# Altium schematic sheet VBATT Sense.SchDoc: Battery Voltage Sense
size A4; ApprovedBy: LD Stanton; Author: LD Stanton; CompanyName: University of Cape Town; DrawnBy: Lawrence Stanton; Engineer: Lawrence Stanton; Organization: University of Cape Town; Address1: Department of Electrical Engineering; Address2: Rondebosch; Address3: Cape Town; Address4: South Africa 7701; DocumentNumber: 11; SheetNumber: 11; SheetTotal: 14
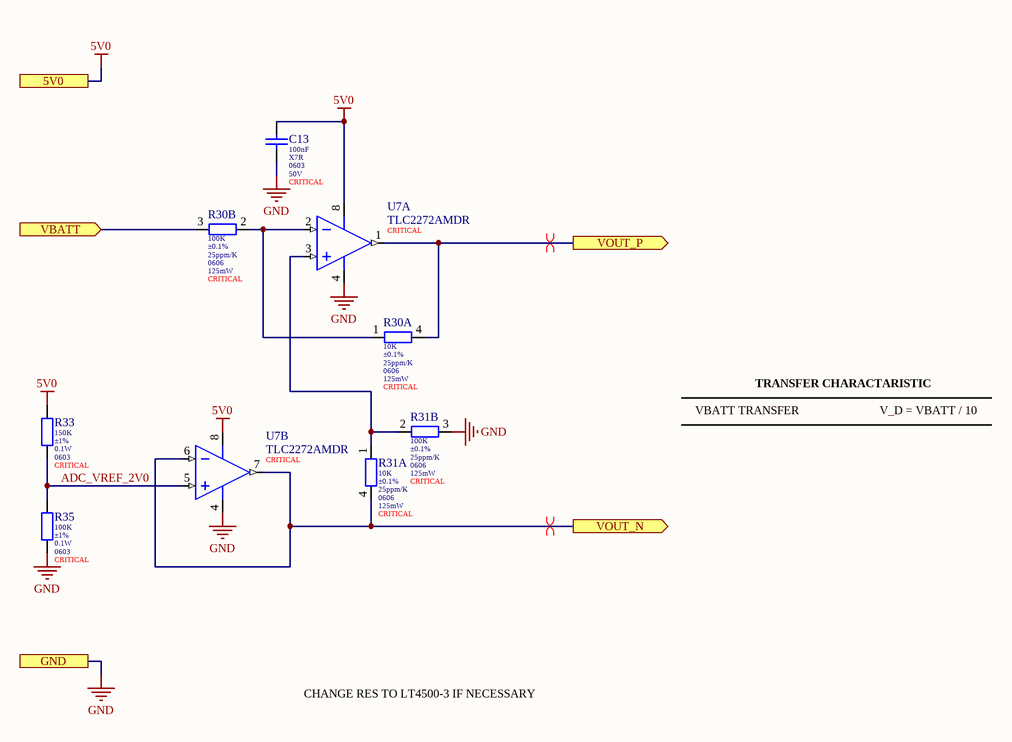
[diagram p0: VBATT Sense.SchDoc]

## Parts
C13  value 100nF  Dielectric: X7R  Package: 0603  Voltage: 50V  Populate: CRITICAL  [0603 (Yageo DA) B]  (hidden comment: CC0603KRX7R9BB104)
R30  value 10K  Tolerance: ±0.1%  Temperature Coefficient: 25ppm/K  Package: 0606  Power: 125mW  Populate: CRITICAL  [0606 (Vishay ACASN) B]  (hidden comment: ACASN1002S1003P1AT)  (parts A,B of 2)
R31  value 10K  Tolerance: ±0.1%  Temperature Coefficient: 25ppm/K  Package: 0606  Power: 125mW  Populate: CRITICAL  [0606 (Vishay ACASN) B]  (hidden comment: ACASN1002S1003P1AT)  (parts A,B of 2)
R33  value 150K  Tolerance: ±1%  Power: 0.1W  Package: 0603  Populate: CRITICAL  [0603 (Uniroyal) B]  (hidden comment: 0603WAF1503T5E)
R35  value 100K  Tolerance: ±1%  Power: 0.1W  Package: 0603  Populate: CRITICAL  [0603 (Uniroyal) B]  (hidden comment: 0603WAF1003T5E)
U7  TLC2272AMDR  Placement: CRITICAL  [SOIC-8 (D008A) B]  (parts A,B of 2)

## Ports
5V0, GND, VBATT (in), VOUT_N (out), VOUT_P (out)

## Nets
5V0: C13.1 R33.1 U7.8(VDD+) ; port 5V0
GND: C13.2 R31.3 R35.2 U7.4(VDD-/GND) ; port GND
ADC_VREF_2V0: R33.2 R35.1 U7.5(IN2+)
VBATT: R30.3 ; port VBATT
VOUT_N: R31.4 U7.6(IN2-) U7.7(OUT2) ; port VOUT_N
VOUT_P: R30.4 U7.1(OUT1) ; port VOUT_P
NetR30_1: R30.1 R30.2 U7.2(IN1-)
NetR31_1: R31.1 R31.2 U7.3(IN1+)

## Layout directives
differential pair: VOUT_N, VOUT_P

## Notes on the sheet
- VBATT TRANSFER
- TRANSFER CHARACTARISTIC
- V_D = VBATT / 10
- CHANGE RES TO LT4500-3 IF NECESSARY
- Size:
- Date:
- A4
- Number:
- Time:
- Revision:
- Sheet
- of
- File:
- Author:

## Library data of the parts
C13 = CMP-047-000000-9: MLCC 100nF 50V 0603 X7R ±10%; Manufacturer: Yageo; Tolerance: ±10%; ComponentLink1Description: Datasheet; ComponentLink1URL: https://datasheet.lcsc.com/szlcsc/YAGEO-CC0603KRX7R9BB104_C14663.pdf; LCSC Part Number: C14663
R30 R31 = CMP-009-00004-9: Resistor Array 100K,10K 0606 ±0.1% Thin Film Vishay; Voltage Rating: 100V; LCSC Part Number: C6733329; Value 2: 100K; Composition: Thin Film; Value 1: 10K; Min Operating Temperature: -55°C; Max Operating Temperature: 125°C; ComponentLink1URL: https://www.vishay.com/docs/28770/acasat.pdf; ComponentLink1Description: Datasheet
R33 = CMP-010-000303-9: Resistor 150K 0603 ±1% Thick Film Uniroyal; Temperature Coefficient: ±100ppm/K; Working Voltage: 75V; Manufacturer: Uniroyal; ComponentLink1URL: https://datasheet.lcsc.com/szlcsc/1811062009_UNI-ROYAL-Uniroyal-Elec-0603WAF1002T5E_C25804.pdf; Temperature: -55 - 155°C; LCSC Part Number: C22807; ComponentLink1Description: Datasheet; Pin Count: 2
R35 = CMP-010-000288-10: Resistor 100K 0603 ±1% Thick Film Uniroyal; Temperature Coefficient: ±100ppm/K; Working Voltage: 75V; LCSC Part Number: C25803; Temperature: -55 - 155°C; ComponentLink1URL: https://datasheet.lcsc.com/szlcsc/1811062009_UNI-ROYAL-Uniroyal-Elec-0603WAF1002T5E_C25804.pdf; Pin Count: 2; Manufacturer: Uniroyal; ComponentLink1Description: Datasheet
U7 = CMP-00126-1: Operational Amplifier, 2 Func, 1500uV Offset-Max, CMOS, PDSO8; Single Supply: Yes; Output Current: 50mA; Input Bias Current: 800pA; Input Offset Voltage: 1.5mV; Supply Max: 8V; Supply Min: -8V; Rail to Rail: Yes; ComponentLink1Description: Datasheet; Input Offset Current: 800pA; LCSC Part Number: C2878284; Min Operating Temperature: -55°C; Max Operating Temperature: 125°C; ComponentLink1URL: https://www.ti.com/lit/ds/symlink/tlc2272.pdf?ts=1754033641708&ref_url=https%253A%252F%252Fwww.ti.com%252Fproduct%252FTLC2272%253Futm_source%253Dgoogle%2526utm_medium%253Dcpc%2526utm_campaign%253Dasc-amps-null-44700045336317476_prodfolderdynamic-cpc-pf-go